# Altium schematic sheet Miscellaneous-Sheet.SchDoc
size A4; SheetNumber: 9; SheetTotal: 9
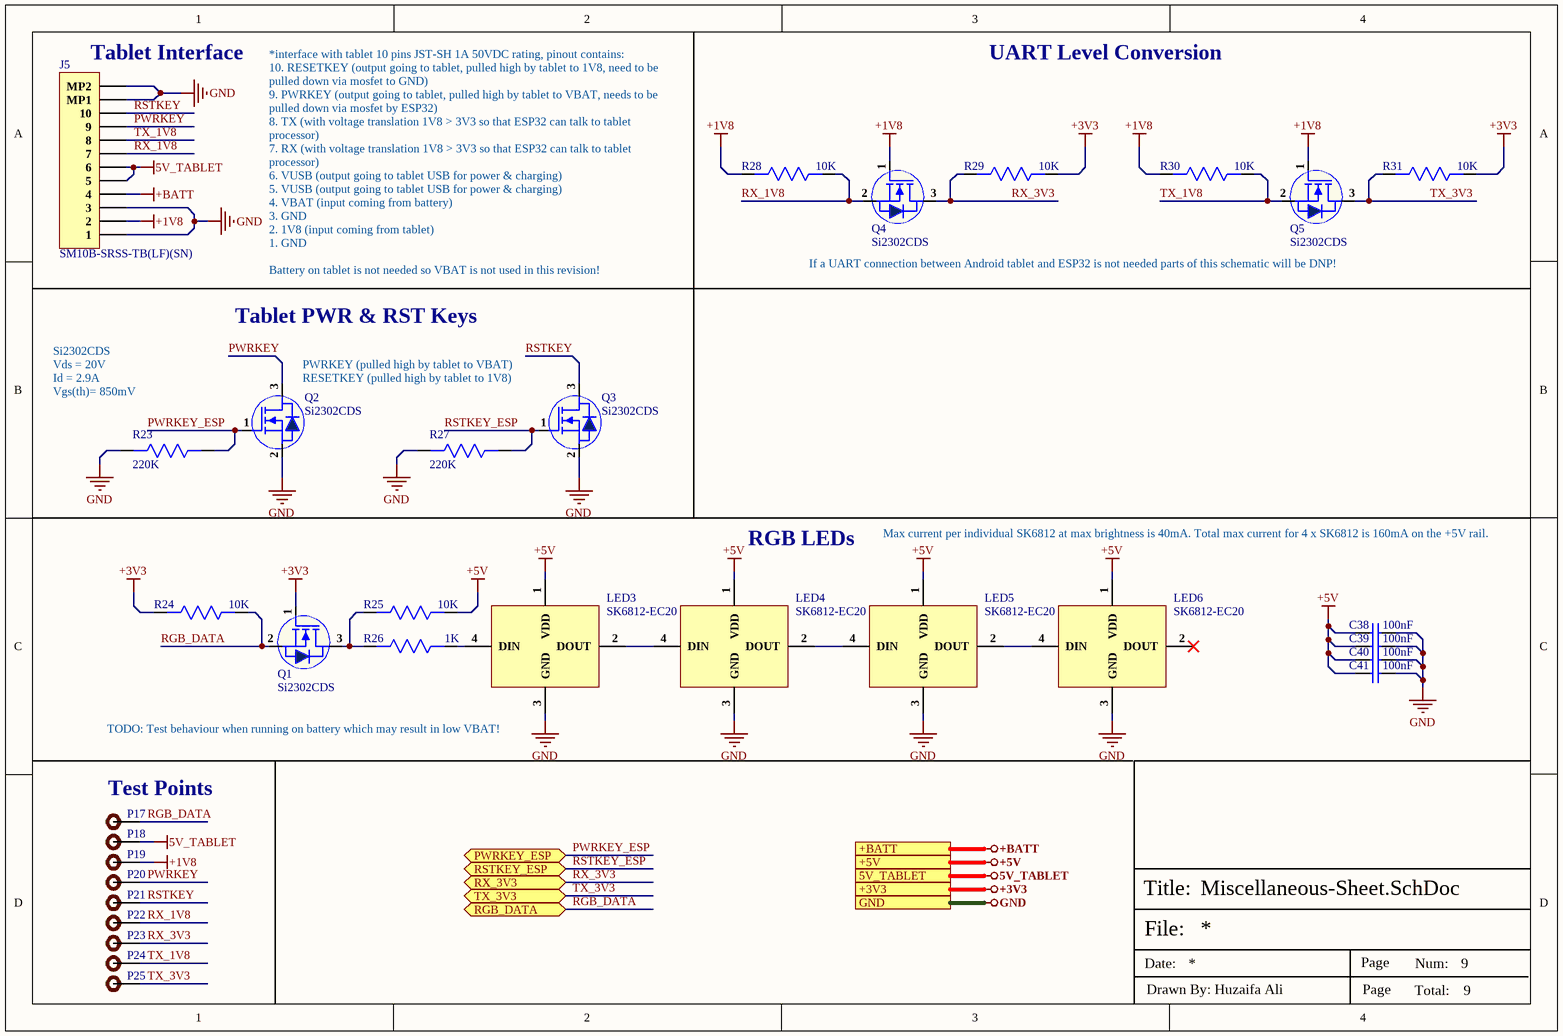
[diagram p0: Miscellaneous-Sheet.SchDoc]

## Parts
C38  100nF  [Cap-0402]
C39  100nF  [Cap-0402]
C40  100nF  [Cap-0402]
C41  100nF  [Cap-0402]
J5  SM10B-SRSS-TB(LF)(SN)  [SM10B-SRSS-TB(LF)(SN)]
LED3  SK6812-EC20  [SK6812-EC20]
LED4  SK6812-EC20  [SK6812-EC20]
LED5  SK6812-EC20  [SK6812-EC20]
LED6  SK6812-EC20  [SK6812-EC20]
P17  TEST POINT  [Test-point]  (value not drawn)
P18  TEST POINT  [Test-point]  (value not drawn)
P19  TEST POINT  [Test-point]  (value not drawn)
P20  TEST POINT  [Test-point]  (value not drawn)
P21  TEST POINT  [Test-point]  (value not drawn)
P22  TEST POINT  [Test-point]  (value not drawn)
P23  TEST POINT  [Test-point]  (value not drawn)
P24  TEST POINT  [Test-point]  (value not drawn)
P25  TEST POINT  [Test-point]  (value not drawn)
Q1  Si2302CDS  [Sot-23]
Q2  Si2302CDS  [Sot-23]
Q3  Si2302CDS  [Sot-23]
Q4  Si2302CDS  [Sot-23]
Q5  Si2302CDS  [Sot-23]
R23  220K  [Res-0402]
R24  10K  [Res-0402]
R25  10K  [Res-0402]
R26  1K  [Res-0402]
R27  220K  [Res-0402]
R28  10K  [Res-0402]
R29  10K  [Res-0402]
R30  10K  [Res-0402]
R31  10K  [Res-0402]

## Ports
5V_TABLET, +3V3, +5V, +BATT, GND, PWRKEY_ESP (bidir), RGB_DATA (bidir), RSTKEY_ESP (bidir), RX_3V3 (bidir), TX_3V3 (bidir)

## Nets
5V_TABLET: J5.5 J5.6 P18.1 ; port 5V_TABLET
+1V8: J5.2 P19.1 Q4.1(G) Q5.1(G) R28.2 R30.2
+3V3: Q1.1(G) R24.2 R29.1 R31.1 ; port +3V3
+5V: C38.1 C39.1 C40.1 C41.1 LED3.1(VDD) LED4.1(VDD) LED5.1(VDD) LED6.1(VDD) R25.1 ; port +5V
+BATT: J5.4 ; port +BATT
GND: C38.2 C39.2 C40.2 C41.2 J5.1 J5.3 J5.MP1 J5.MP2 LED3.3(GND) LED4.3(GND) LED5.3(GND) LED6.3(GND) Q2.2(S) Q3.2(S) R23.2 R27.2 ; port GND
PWRKEY: J5.9 P20.1 Q2.3(D)
PWRKEY_ESP: Q2.1(G) R23.1 ; port PWRKEY_ESP
RGB_DATA: P17.1 Q1.2(S) R24.1 ; port RGB_DATA
RSTKEY: J5.10 P21.1 Q3.3(D)
RSTKEY_ESP: Q3.1(G) R27.1 ; port RSTKEY_ESP
RX_1V8: J5.7 P22.1 Q4.2(S) R28.1
RX_3V3: P23.1 Q4.3(D) R29.2 ; port RX_3V3
TX_1V8: J5.8 P24.1 Q5.2(S) R30.1
TX_3V3: P25.1 Q5.3(D) R31.2 ; port TX_3V3
NetLED3_2: LED3.2(DOUT) LED4.4(DIN)
NetLED3_4: LED3.4(DIN) R26.1
NetLED4_2: LED4.2(DOUT) LED5.4(DIN)
NetLED5_2: LED5.2(DOUT) LED6.4(DIN)
NetQ1_3: Q1.3(D) R25.2 R26.2

Not connected (* = marked no-connect by the designer): LED6 2(DOUT)*

## Notes on the sheet
- (near J5) Tablet Interface
- UART Level Conversion
- *interface with tablet 10 pins JST-SH 1A 50VDC rating, pinout contains:
  10. RESETKEY (output going to tablet, pulled high by tablet to 1V8, need to be pulled down via mosfet to GND)
  9. PWRKEY (output going to tablet, pulled high by tablet to VBAT, needs to be pulled down via mosfet by ESP32)
  8. TX (with voltage translation 1V8 > 3V3 so that ESP32 can talk to tablet processor)
  7. RX (with voltage translation 1V8 > 3V3 so that ESP32 can talk to tablet processor)
  6. VUSB (output going to tablet USB for power & charging)
  5. VUSB (output going to tablet USB for power & charging)
  4. VBAT (input coming from battery)
  3. GND
  2. 1V8 (input coming from tablet)
  1. GND
  Battery on tablet is not needed so VBAT is not used in this revision!
- Tablet PWR & RST Keys
- If a UART connection between Android tablet and ESP32 is not needed parts of this schematic will be DNP!
- PWRKEY (pulled high by tablet to VBAT)
  RESETKEY (pulled high by tablet to 1V8)
- (near R23) Si2302CDS
  Vds = 20V
  Id = 2.9A
  Vgs(th)= 850mV
- RGB LEDs
- Max current per individual SK6812 at max brightness is 40mA. Total max current for 4 x SK6812 is 160mA on the +5V rail.
- (near LED3) TODO: Test behaviour when running on battery which may result in low VBAT!
- (near P17) Test Points
- File:
- Title:
- Date:
- Page
- Num:
- Total:
- Drawn By: Huzaifa Ali

## Library data of the parts
C38-C41 = CC0402KRX5R8BB104: CAP CER 0.1UF 25V X5R 0402; Manufacturer: Yageo; Tolerance: 10%; Item Type: Capacitor; Supplier 1: Digi-Key; Manufacturer Part Number: CC0402KRX5R8BB104; RoHS: Yes; Category: Ceramic Capacitors; Stock 1: 4598218; Pricing 1: 1=0.10000, 10=0.03800, 50=0.02100, 100=0.01710, 500=0.01224, 1000=0.00961, 2500=0.00874, 5000=0.00804 (USD); Mount: Surface Mount; Case/Package: 0402; Case Code (Metric): 1005; Case Code (Imperial): 0402; Min Operating Temperature: -55°C; Max Operating Temperature: 85°C; Voltage Rating: 25V; Packaging: Tape and Reel; Capacitance: 100nF; Voltage Rating (DC): 25V; Dielectric: X5R; Resistor Type: Ceramic; Series: CC; Length: 0.039inch; Width: 0.02inch; Thickness: 0.022inch; Depth: 0.5mm; Lead Free: Lead Free; Halogen Free: Halogen Free; RoHS Compliant: Yes; ComponentLink1URL: http://www.mouser.com/ds/2/447/UPY-GPHC_X5R_4V-to-50V_25-1131599.pdf?src-supplier=Mouser; ComponentLink1Description: http://www.mouser.com/ds/2/447/UPY-GPHC_X5R_4V-to-50V_25-1131599.pdf?src-supplier=Mouser; ComponentLink2URL: http://www.yageo.com/documents/recent/UPY-GPHC_X5R_4V-to-50V-16.pdf?src-supplier=Future+Electronics; ComponentLink2Description: http://www.yageo.com/documents/recent/UPY-GPHC_X5R_4V-to-50V-16.pdf?src-supplier=Future+Electronics; ComponentLink3URL: http://www.yageo.com/documents/recent/UPY-GPHC_X5R_4V-to-50V_25.pdf?src-supplier=Digi-Key; ComponentLink3Description: http://www.yageo.com/documents/recent/UPY-GPHC_X5R_4V-to-50V_25.pdf?src-supplier=Digi-Key; Supplier Part Number 1: 311-1697-1-ND; LCSC Part Number: C106256
J5 = SM10B-SRSS-TB(LF)(SN): CONN HEADER SMD R/A 10POS 1MM; Manufacturer: JST; Contact Resistance: 40mR; Current Rating: 1A; Voltage Rating (AC): 50V; Gender: Male; Number of Positions: 10; Insulation Resistance: 100MR; Item Type: JST Connector; Supplier 1: Future Electronics; Manufacturer Part Number: SM10B-SRSS-TB(LF)(SN); RoHS: Yes; Category: Connectors; Pricing 1: 3000=0.64500 (USD); Mount: Surface Mount; Contact Plating: Tin,Lead,Copper; Contact Material: Copper Alloy; Color: Natural; Material: Polyamide; Housing Color: Beige; Housing Material: Polyamide; Contact Shape: Square; Contact Finish - Mating: TIN; Insulation Material: Nylon; Insulation Color: Natural; Min Operating Temperature: -25°C; Max Operating Temperature: 85°C; Number of Rows: 1; Packaging: Tape and Reel; Max Current Rating: 1A; Voltage Rating: 50V; Termination: Solder; Max Voltage Rating (AC): 50V; Number of Contacts: 10; Orientation: Right Angle; Connector Type: Header; Series: SR; Contact Type: Male Pin; Fastening Type: Pull; Length: 12mm; Lead Pitch: 1mm; Pitch: 1mm; Depth: 4.95mm; Reach SVHC Compliant: Yes; Lead Free: Lead Free; Flammability Rating: UL94 V-0; ComponentLink1URL: https://datasheet.ciiva.com/26894/getdatasheetpartid-708886-26894682.pdf?src-supplier=Verical; ComponentLink1Description: https://datasheet.ciiva.com/26894/getdatasheetpartid-708886-26894682.pdf?src-supplier=Verical; ComponentLink2URL: https://datasheet.ciiva.com/16221/sm10b-srss-tblfsn-16221242.pdf?src-supplier=Future+Electronics; ComponentLink2Description: https://datasheet.ciiva.com/16221/sm10b-srss-tblfsn-16221242.pdf?src-supplier=Future+Electronics; ComponentLink3URL: https://datasheet.ciiva.com/11752/0900766b8082f550-11752172.pdf?src-supplier=RSComponents; ComponentLink3Description: https://datasheet.ciiva.com/11752/0900766b8082f550-11752172.pdf?src-supplier=RSComponents; ComponentLink4URL: https://datasheet.ciiva.com/712/esr-712644.pdf?src-supplier=Digi-Key; ComponentLink4Description: https://datasheet.ciiva.com/712/esr-712644.pdf?src-supplier=Digi-Key; ComponentLink5URL: https://datasheet.ciiva.com/712/esr-712645.pdf?src-supplier=Digi-Key; ComponentLink5Description: https://datasheet.ciiva.com/712/esr-712645.pdf?src-supplier=Digi-Key; ComponentLink6URL: https://datasheet.ciiva.com/730/esr-730692.pdf?src-supplier=Digi-Key; ComponentLink6Description: https://datasheet.ciiva.com/730/esr-730692.pdf?src-supplier=Digi-Key; Supplier Part Number 1: 1165778; LCSC Part Number: C160409
LED3-LED6 = SK6812-EC20: 5mA -40℃~+80℃ RGB SMD,2x2mm Light Emitting Diodes (LED) ROHS; Manufacturer: OPSCO Optoelectronics; Item Type: RGB LED; Manufacturer Part Number: SK6812-EC20; Package: SMD,2x2mm; LCSC Part Number: C2909058; ComponentLink1Description: LCSC; ComponentLink1URL: https://www.lcsc.com/product-detail/Light-Emitting-Diodes-LED_OPSCO-Optoelectronics-SK6812-EC20_C2909058.html
P17-P25 = TEST POINT: Test Point ON
Q1-Q5 = Si2302CDS: N-CHANNEL 20-V (D-S) MOSFET; Manufacturer: TECH PUBLIC; ComponentLink1Description: LCSC; ComponentLink1URL: https://www.lcsc.com/product-detail/MOSFETs_TECH-PUBLIC-SI2302CDS_C5310968.html; Manufacturer Part Number: SI2302CDS; Package: SOT-23; LCSC Part Number: C5310968; Item Type: Mosfet
R23 R27 = RC0402FR-07220KL: RES 220K OHM 1% 1/16W 0402; Manufacturer: Yageo; Resistance: 220kR; Power Rating: 62.5mW; Voltage Rating: 50V; Temperature Coefficient: 100ppm/°C; Max Power Dissipation: 63mW; Supplier 1: Digi-Key; Manufacturer Part Number: RC0402FR-07220KL; RoHS: Yes; Category: Chip SMD Resistors; Stock 1: 1192792; Pricing 1: 1=0.10000, 10=0.01400, 100=0.00580, 1000=0.00262, 2500=0.00228, 5000=0.00188 (USD); Case/Package: 0402; Case Code (Imperial): 0402; Case Code (Metric): 1005; Weight: 2.3E-05oz; Size Code: 0402; Min Operating Temperature: -55°C; Max Operating Temperature: 155°C; Tolerance: 1%; Package Quantity: 1; Packaging: Tape and Reel; Termination: SMD/SMT; Resistor Type: Thick Film; Number of Terminations: 2; Features: Moisture Resistant; Series: RC; Resistance Tolerance: 1%; Technology: THICK FILM; Construction: Rectangular; Length: 1mm; Width: 0.02inch; Height: 0.016inch; Depth: 0.5mm; RoHS Compliant: Yes; Reach SVHC Compliant: Yes; Military Standard: Not; Lead Free: Lead Free; ComponentLink1URL: https://datasheet.ciiva.com/11808/0900766b80c66297-11808792.pdf?src-supplier=RSComponents; ComponentLink1Description: https://datasheet.ciiva.com/11808/0900766b80c66297-11808792.pdf?src-supplier=RSComponents; ComponentLink2URL: https://datasheet.ciiva.com/5924/1018594-5924944.pdf?src-supplier=Farnell; ComponentLink2Description: https://datasheet.ciiva.com/5924/1018594-5924944.pdf?src-supplier=Farnell; ComponentLink3URL: https://datasheet.ciiva.com/2453/pyu-r-int-thick-7-2453533.pdf?src-supplier=Digi-Key; ComponentLink3Description: https://datasheet.ciiva.com/2453/pyu-r-int-thick-7-2453533.pdf?src-supplier=Digi-Key; ComponentLink4URL: https://datasheet.ciiva.com/2453/pyu-r-int-thick-7-2453534.pdf?src-supplier=Digi-Key; ComponentLink4Description: https://datasheet.ciiva.com/2453/pyu-r-int-thick-7-2453534.pdf?src-supplier=Digi-Key; ComponentLink5URL: https://datasheet.ciiva.com/2453/pyu-r-int-thick-7-2453532.pdf?src-supplier=Digi-Key; ComponentLink5Description: https://datasheet.ciiva.com/2453/pyu-r-int-thick-7-2453532.pdf?src-supplier=Digi-Key; ComponentLink6URL: https://datasheet.ciiva.com/12577/pyu-rc0402-51-rohs-l-6-r-12577270.pdf?src-supplier=Mouser; ComponentLink6Description: https://datasheet.ciiva.com/12577/pyu-rc0402-51-rohs-l-6-r-12577270.pdf?src-supplier=Mouser; Supplier Part Number 1: 311-220KLRCT-ND
R24 R25 R28-R31 = RC0402FR-0710KL: RES 10K OHM 1% 1/16W 0402; Manufacturer: Yageo; Resistance: 10kR; Voltage Rating (DC): 50V; Temperature Coefficient: 100ppm/°C; Power Rating: 62.5mW; Max Power Dissipation: 63mW; Supplier 1: Mouser; Manufacturer Part Number: RC0402FR-0710KL; RoHS: Yes; Category: Chip SMD Resistors; Stock 1: 18648329; Pricing 1: 1=0.10000, 10=0.01400, 50=0.01400, 100=0.00500, 1000=0.00300, 10000=0.00200 (USD); Case/Package: 0402; Number of Pins: 2; Case Code (Imperial): 0402; Case Code (Metric): 1005; Min Operating Temperature: -55°C; Max Operating Temperature: 155°C; Resistor Type: Thick Film; Tolerance: 1%; Packaging: Tape and Reel; Voltage Rating: 50V; Termination: SMD/SMT; Working Voltage: 50V; Number of Terminations: 2; Features: Moisture Resistant; Series: RC; Resistance Tolerance: 1%; Construction: Rectangular; Length: 1mm; Width: 0.5mm; Height: 0.32mm; Depth: 0.5mm; Lead Pitch: 0.2mm; REACH SVHC: No SVHC; Lead Free: Lead Free; RoHS Compliant: Yes; Military Standard: Not; ComponentLink1URL: https://datasheet.ciiva.com/7660/38568-7660787.pdf?src-supplier=Element14; ComponentLink1Description: https://datasheet.ciiva.com/7660/38568-7660787.pdf?src-supplier=Element14; ComponentLink2URL: https://datasheet.ciiva.com/7849/1686128-7849814.pdf?src-supplier=Element14; ComponentLink2Description: https://datasheet.ciiva.com/7849/1686128-7849814.pdf?src-supplier=Element14; ComponentLink3URL: https://datasheet.ciiva.com/7983/1018594-7983486.pdf?src-supplier=Element14; ComponentLink3Description: https://datasheet.ciiva.com/7983/1018594-7983486.pdf?src-supplier=Element14; ComponentLink4URL: https://datasheet.ciiva.com/22747/1018594-22747512.pdf?src-supplier=Element14; ComponentLink4Description: https://datasheet.ciiva.com/22747/1018594-22747512.pdf?src-supplier=Element14; ComponentLink5URL: https://datasheet.ciiva.com/12667/pyu-rc0402-51-rohs-l-6-r-12667067.pdf?src-supplier=Mouser; ComponentLink5Description: https://datasheet.ciiva.com/12667/pyu-rc0402-51-rohs-l-6-r-12667067.pdf?src-supplier=Mouser; ComponentLink6URL: https://datasheet.ciiva.com/7849/1784430-7849813.pdf?src-supplier=Element14; ComponentLink6Description: https://datasheet.ciiva.com/7849/1784430-7849813.pdf?src-supplier=Element14; ComponentLink7URL: https://datasheet.ciiva.com/7849/1784430-7849815.pdf?src-supplier=Element14; ComponentLink7Description: https://datasheet.ciiva.com/7849/1784430-7849815.pdf?src-supplier=Element14; Supplier Part Number 1: 603-RC0402FR-0710KL; LCSC Part Number: C60490
R26 = RC0402FR-071KL: RES 1K OHM 1% 1/16W 0402; Manufacturer: Yageo; Resistance: 1kR; Temperature Coefficient: 100ppm/°C; Voltage Rating (DC): 50V; Power Rating: 62.5mW; Max Power Dissipation: 63mW; Item Type: Resistor; Supplier 1: Avnet; Manufacturer Part Number: RC0402FR-071KL; RoHS: Yes; Category: Chip SMD Resistors; Stock 1: 13030000; Pricing 1: 10000=0.00085, 20000=0.00087, 40000=0.00084, 60000=0.00083, 80000=0.00079, 100000=0.00078, 1000000=0.00076 (USD); Case/Package: 0402; Number of Pins: 2; Case Code (Imperial): 0402; Case Code (Metric): 1005; Size Code: 0402; Min Operating Temperature: -55°C; Max Operating Temperature: 155°C; Resistor Type: Thick Film; Tolerance: 1%; Packaging: Tape and Reel; Voltage Rating: 50V; Termination: SMD/SMT; Features: Moisture Resistant; Series: RC; Number of Terminations: 2; Resistance Tolerance: 1%; Construction: Rectangular; Technology: THICK FILM; Length: 1mm; Width: 0.5mm; Height: 0.32mm; Depth: 0.5mm; Reach SVHC Compliant: Yes; Lead Free: Lead Free; RoHS Compliant: Yes; Military Standard: Not; ComponentLink1URL: https://datasheet.ciiva.com/11819/0900766b80c66297-11819477.pdf?src-supplier=RSComponents; ComponentLink1Description: https://datasheet.ciiva.com/11819/0900766b80c66297-11819477.pdf?src-supplier=RSComponents; ComponentLink2URL: https://datasheet.ciiva.com/7983/1018594-7983502.pdf?src-supplier=Element14; ComponentLink2Description: https://datasheet.ciiva.com/7983/1018594-7983502.pdf?src-supplier=Element14; ComponentLink3URL: https://datasheet.ciiva.com/22747/1018594-22747513.pdf?src-supplier=Element14; ComponentLink3Description: https://datasheet.ciiva.com/22747/1018594-22747513.pdf?src-supplier=Element14; ComponentLink4URL: https://datasheet.ciiva.com/12666/pyu-rc0402-51-rohs-l-6-r-12666741.pdf?src-supplier=Mouser; ComponentLink4Description: https://datasheet.ciiva.com/12666/pyu-rc0402-51-rohs-l-6-r-12666741.pdf?src-supplier=Mouser; ComponentLink5URL: https://datasheet.ciiva.com/7849/1018594-7849869.pdf?src-supplier=Element14; ComponentLink5Description: https://datasheet.ciiva.com/7849/1018594-7849869.pdf?src-supplier=Element14; ComponentLink6URL: https://datasheet.ciiva.com/7849/1018594-7849871.pdf?src-supplier=Element14; ComponentLink6Description: https://datasheet.ciiva.com/7849/1018594-7849871.pdf?src-supplier=Element14; ComponentLink7URL: https://datasheet.ciiva.com/17063/pyu-rc0402-51-rohs-l-6-r-17063193.pdf?src-supplier=Future+Electronics; ComponentLink7Description: https://datasheet.ciiva.com/17063/pyu-rc0402-51-rohs-l-6-r-17063193.pdf?src-supplier=Future+Electronics; Supplier Part Number 1: RC0402FR-071KL; LCSC Part Number: C106235